# EAGLE board waveform (EAGLE 9.6.2), part 1 of 2
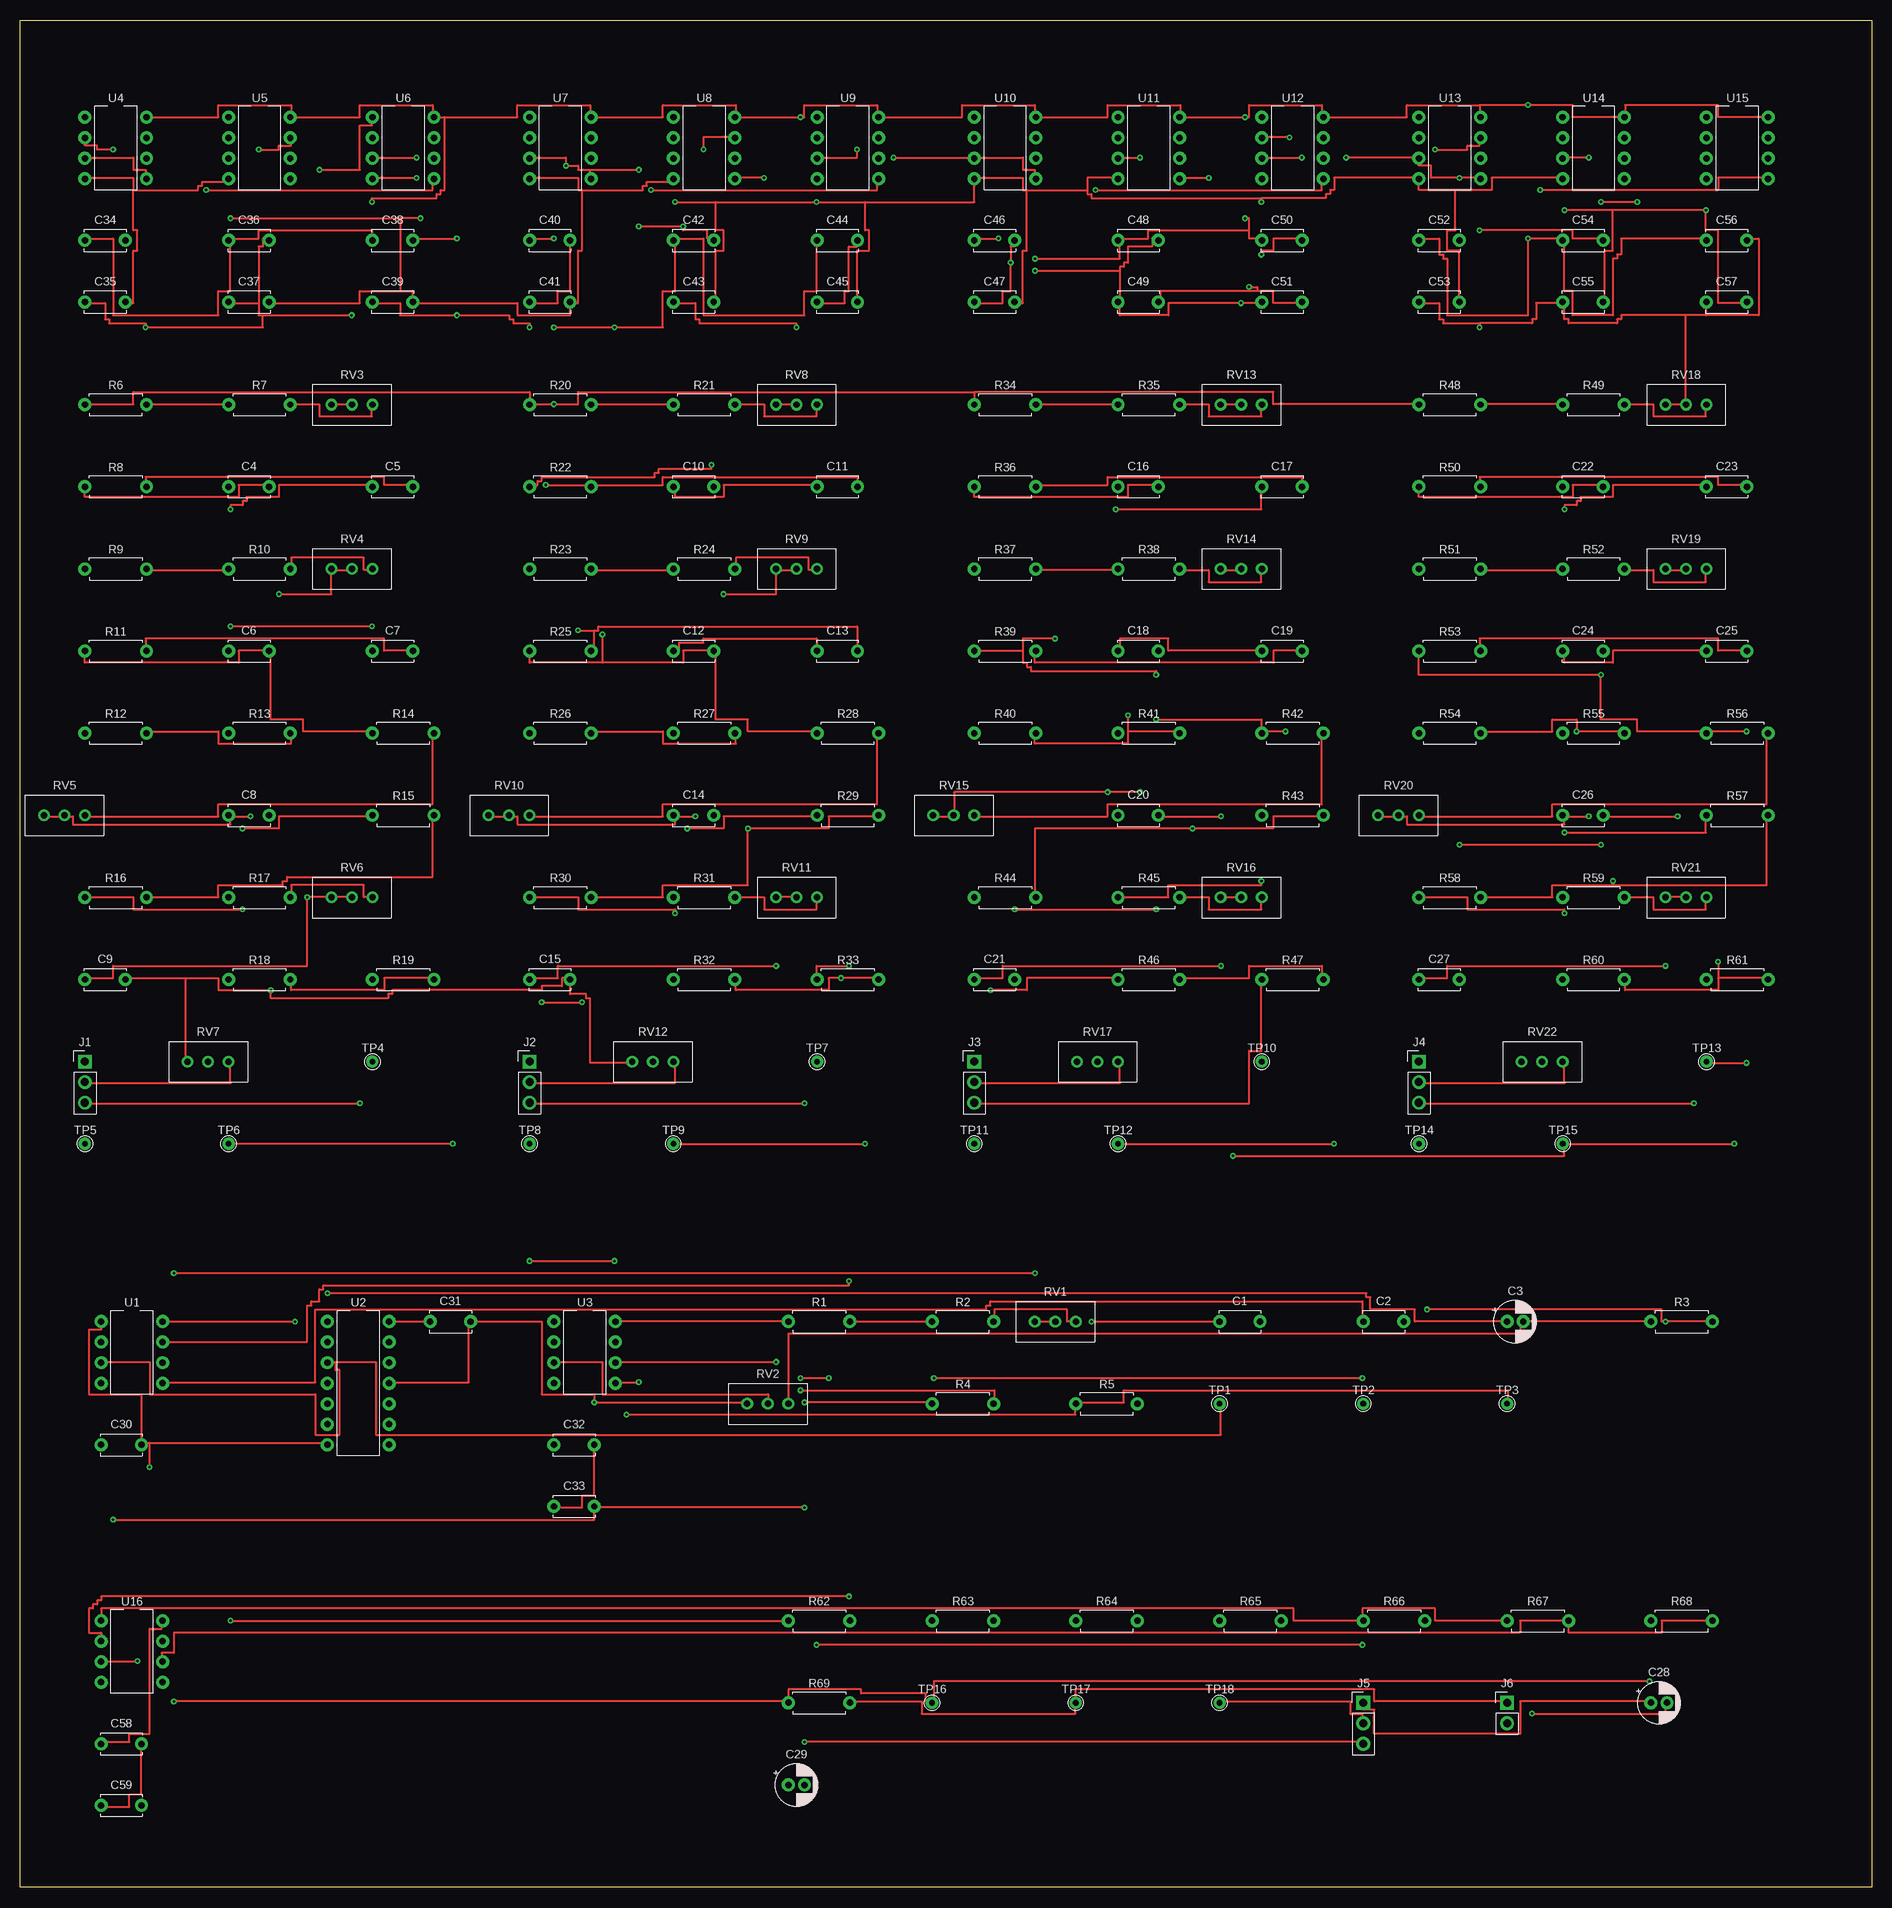
[diagram p9: board, top side]
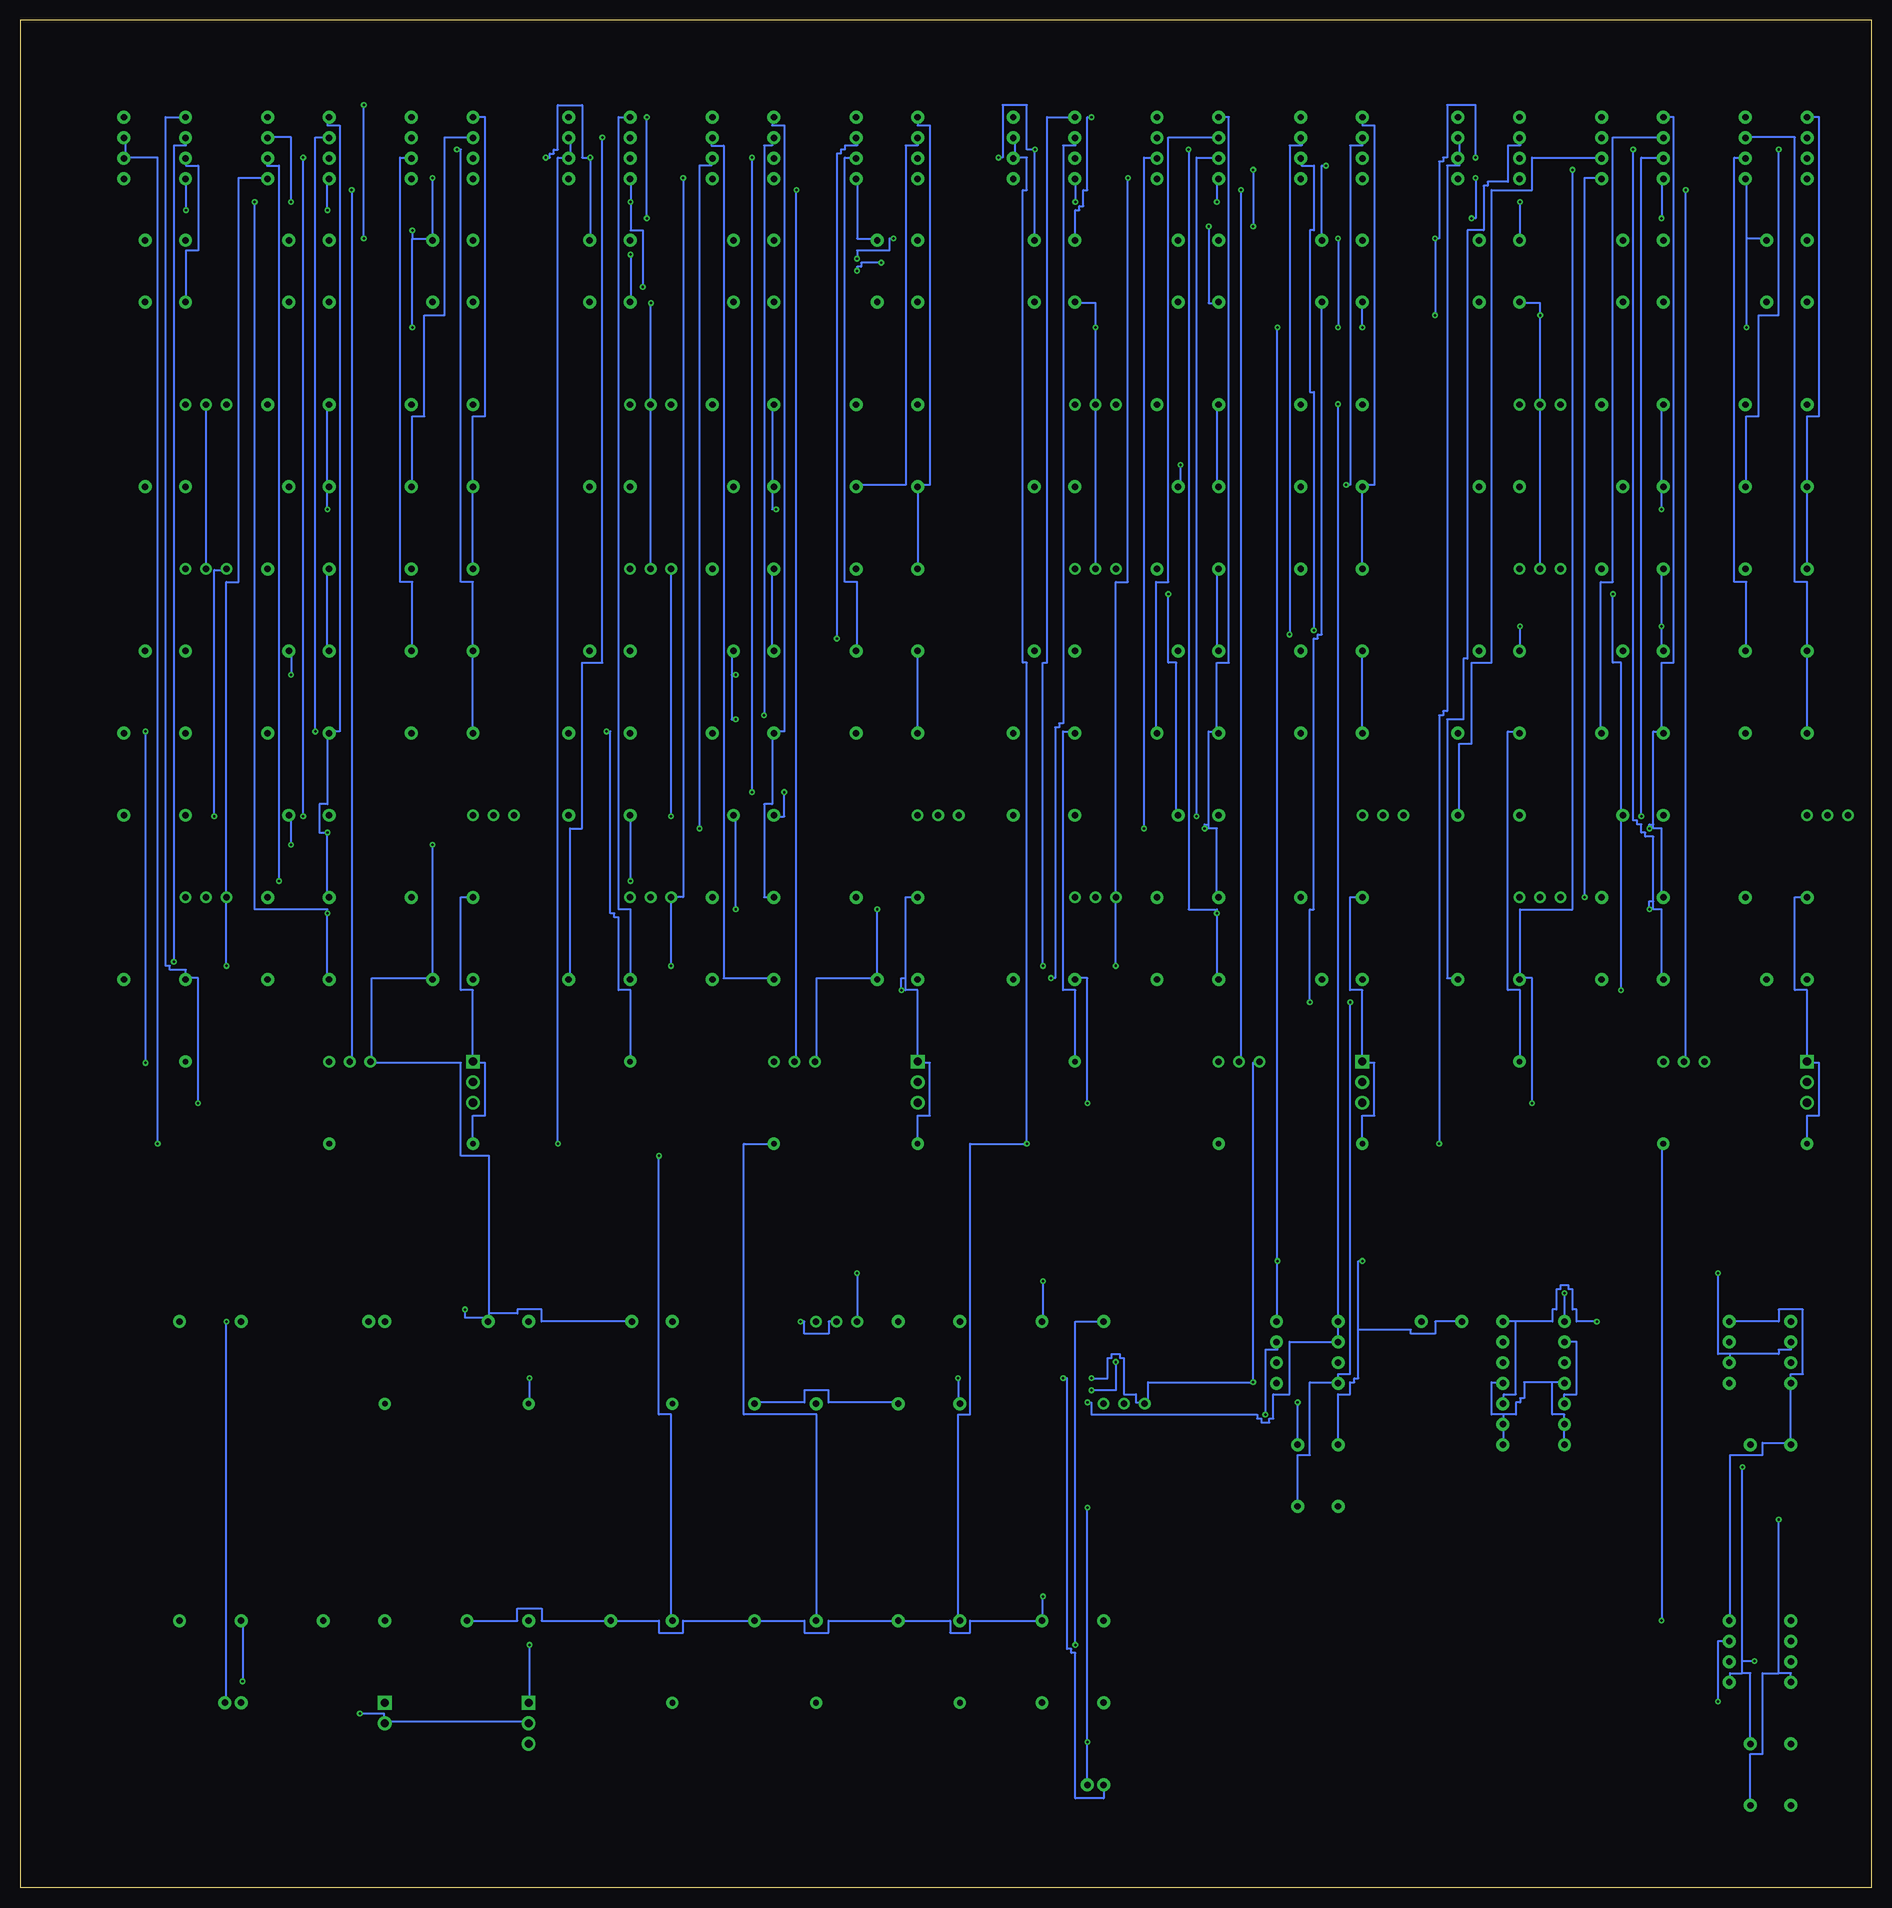
[diagram p10: board, bottom side, seen from below]

Size 229 x 231 mm. Coordinates in mm from the lower left corner, seen from the top.
Outline: 229,0 0,0 0,231 229,231 229,0
Copper layers (1*16): Top 0.035mm / Bottom 0.035mm
Design rules "Waveform_2layer_0.20mm": minimum track width 0.25mm, minimum drill 0.3mm, track to track 0.2mm, track to pad 0.2mm, pad to pad 0.2mm, via to via 0.2mm, copper to edge 0.5mm, stop-mask expansion 0.05mm
Net classes: 0 default: width 0.25 mm, drill 0.3 mm, clearance 0.2 mm

## Footprints (pad centres in the part's own frame; a part is rotated, then mirrored left to right if it is on the bottom)
C_Disc_D5.0mm_W2.5mm_P5.00mm = drill 0.8 pad 1.6 round: 1 0,0; 2 5,0
CP_Radial_D5.0mm_P2.00mm = drill 0.8 pad 1.6 round: 1 0,0; 2 2,0
PinHeader_1x03_P2.54mm_Vertical = drill 1 pad 1.7 square: 1 0,0 | drill 1 pad 1.7 round: 2 0,-2.54; 3 0,-5.08
PinHeader_1x02_P2.54mm_Vertical = drill 1 pad 1.7 square: 1 0,0 | drill 1 pad 1.7 round: 2 0,-2.54
R_Axial_DIN0207_L6.3mm_D2.5mm_P7.62mm_Horizontal = drill 0.8 pad 1.6 round: 1 0,0; 2 7.62,0
Potentiometer_Bourns_3296W_Vertical = drill 0.8 pad 1.44 round: 1 0,0; 2 -2.54,0; 3 -5.08,0
TestPoint_THTPad_D1.5mm_Drill0.7mm = drill 0.7 pad 1.5 round: 1 0,0
DIP-8_W7.62mm = drill 0.8 pad 1.6 round: 1 0,0; 2 0,-2.54; 3 0,-5.08; 4 0,-7.62; 5 7.62,-7.62; 6 7.62,-5.08; 7 7.62,-2.54; 8 7.62,0
DIP-14_W7.62mm = drill 0.8 pad 1.6 round: 1 0,0; 2 0,-2.54; 3 0,-5.08; 4 0,-7.62; 5 0,-10.16; 6 0,-12.7; 7 0,-15.24; 8 7.62,-15.24; 9 7.62,-12.7; 10 7.62,-10.16; 11 7.62,-7.62; 12 7.62,-5.08; 13 7.62,-2.54; 14 7.62,0

## Placement (x,y rotation side)
C1  10n  [C_Disc_D5.0mm_W2.5mm_P5.00mm]  148.34,70 0 top
C2  10n  [C_Disc_D5.0mm_W2.5mm_P5.00mm]  166.12,70 0 top
C3  10u/25V  [CP_Radial_D5.0mm_P2.00mm]  183.9,70 0 top
C4  10n  [C_Disc_D5.0mm_W2.5mm_P5.00mm]  25.78,173.28 0 top
C5  10n  [C_Disc_D5.0mm_W2.5mm_P5.00mm]  43.56,173.28 0 top
C6  10n  [C_Disc_D5.0mm_W2.5mm_P5.00mm]  25.78,152.96 0 top
C7  10n  [C_Disc_D5.0mm_W2.5mm_P5.00mm]  43.56,152.96 0 top
C8  10n  [C_Disc_D5.0mm_W2.5mm_P5.00mm]  25.78,132.64 0 top
C9  10n  [C_Disc_D5.0mm_W2.5mm_P5.00mm]  8,112.32 0 top
C10  3.3n  [C_Disc_D5.0mm_W2.5mm_P5.00mm]  80.78,173.28 0 top
C11  3.3n  [C_Disc_D5.0mm_W2.5mm_P5.00mm]  98.56,173.28 0 top
C12  3.3n  [C_Disc_D5.0mm_W2.5mm_P5.00mm]  80.78,152.96 0 top
C13  3.3n  [C_Disc_D5.0mm_W2.5mm_P5.00mm]  98.56,152.96 0 top
C14  3.3n  [C_Disc_D5.0mm_W2.5mm_P5.00mm]  80.78,132.64 0 top
C15  3.3n  [C_Disc_D5.0mm_W2.5mm_P5.00mm]  63,112.32 0 top
C16  2n  [C_Disc_D5.0mm_W2.5mm_P5.00mm]  135.78,173.28 0 top
C17  2n  [C_Disc_D5.0mm_W2.5mm_P5.00mm]  153.56,173.28 0 top
C18  2n  [C_Disc_D5.0mm_W2.5mm_P5.00mm]  135.78,152.96 0 top
C19  2n  [C_Disc_D5.0mm_W2.5mm_P5.00mm]  153.56,152.96 0 top
C20  2n  [C_Disc_D5.0mm_W2.5mm_P5.00mm]  135.78,132.64 0 top
C21  2n  [C_Disc_D5.0mm_W2.5mm_P5.00mm]  118,112.32 0 top
C22  1.5n  [C_Disc_D5.0mm_W2.5mm_P5.00mm]  190.78,173.28 0 top
C23  1.5n  [C_Disc_D5.0mm_W2.5mm_P5.00mm]  208.56,173.28 0 top
C24  1.5n  [C_Disc_D5.0mm_W2.5mm_P5.00mm]  190.78,152.96 0 top
C25  1.5n  [C_Disc_D5.0mm_W2.5mm_P5.00mm]  208.56,152.96 0 top
C26  1.5n  [C_Disc_D5.0mm_W2.5mm_P5.00mm]  190.78,132.64 0 top
C27  1.5n  [C_Disc_D5.0mm_W2.5mm_P5.00mm]  173,112.32 0 top
C28  47u/25V  [CP_Radial_D5.0mm_P2.00mm]  201.68,22.84 0 top
C29  47u/25V  [CP_Radial_D5.0mm_P2.00mm]  95,12.68 0 top
C30  100n  [C_Disc_D5.0mm_W2.5mm_P5.00mm]  10,54.76 0 top
C31  100n  [C_Disc_D5.0mm_W2.5mm_P5.00mm]  50.7,70 0 top
C32  100n  [C_Disc_D5.0mm_W2.5mm_P5.00mm]  66,54.76 0 top
C33  100n  [C_Disc_D5.0mm_W2.5mm_P5.00mm]  66,47.14 0 top
C34  100n  [C_Disc_D5.0mm_W2.5mm_P5.00mm]  8,203.76 0 top
C35  100n  [C_Disc_D5.0mm_W2.5mm_P5.00mm]  8,196.14 0 top
C36  100n  [C_Disc_D5.0mm_W2.5mm_P5.00mm]  25.78,203.76 0 top
C37  100n  [C_Disc_D5.0mm_W2.5mm_P5.00mm]  25.78,196.14 0 top
C38  100n  [C_Disc_D5.0mm_W2.5mm_P5.00mm]  43.56,203.76 0 top
C39  100n  [C_Disc_D5.0mm_W2.5mm_P5.00mm]  43.56,196.14 0 top
C40  100n  [C_Disc_D5.0mm_W2.5mm_P5.00mm]  63,203.76 0 top
C41  100n  [C_Disc_D5.0mm_W2.5mm_P5.00mm]  63,196.14 0 top
C42  100n  [C_Disc_D5.0mm_W2.5mm_P5.00mm]  80.78,203.76 0 top
C43  100n  [C_Disc_D5.0mm_W2.5mm_P5.00mm]  80.78,196.14 0 top
C44  100n  [C_Disc_D5.0mm_W2.5mm_P5.00mm]  98.56,203.76 0 top
C45  100n  [C_Disc_D5.0mm_W2.5mm_P5.00mm]  98.56,196.14 0 top
C46  100n  [C_Disc_D5.0mm_W2.5mm_P5.00mm]  118,203.76 0 top
C47  100n  [C_Disc_D5.0mm_W2.5mm_P5.00mm]  118,196.14 0 top
C48  100n  [C_Disc_D5.0mm_W2.5mm_P5.00mm]  135.78,203.76 0 top
C49  100n  [C_Disc_D5.0mm_W2.5mm_P5.00mm]  135.78,196.14 0 top
C50  100n  [C_Disc_D5.0mm_W2.5mm_P5.00mm]  153.56,203.76 0 top
C51  100n  [C_Disc_D5.0mm_W2.5mm_P5.00mm]  153.56,196.14 0 top
C52  100n  [C_Disc_D5.0mm_W2.5mm_P5.00mm]  173,203.76 0 top
C53  100n  [C_Disc_D5.0mm_W2.5mm_P5.00mm]  173,196.14 0 top
C54  100n  [C_Disc_D5.0mm_W2.5mm_P5.00mm]  190.78,203.76 0 top
C55  100n  [C_Disc_D5.0mm_W2.5mm_P5.00mm]  190.78,196.14 0 top
C56  100n  [C_Disc_D5.0mm_W2.5mm_P5.00mm]  208.56,203.76 0 top
C57  100n  [C_Disc_D5.0mm_W2.5mm_P5.00mm]  208.56,196.14 0 top
C58  100n  [C_Disc_D5.0mm_W2.5mm_P5.00mm]  10,17.76 0 top
C59  100n  [C_Disc_D5.0mm_W2.5mm_P5.00mm]  10,10.14 0 top
J1  PHASE_POLARITY  [PinHeader_1x03_P2.54mm_Vertical]  8,102.16 0 top
J2  PHASE_POLARITY  [PinHeader_1x03_P2.54mm_Vertical]  63,102.16 0 top
J3  PHASE_POLARITY  [PinHeader_1x03_P2.54mm_Vertical]  118,102.16 0 top
J4  PHASE_POLARITY  [PinHeader_1x03_P2.54mm_Vertical]  173,102.16 0 top
J5  POWER_12V  [PinHeader_1x03_P2.54mm_Vertical]  166.12,22.84 0 top
J6  WAVE_OUT  [PinHeader_1x02_P2.54mm_Vertical]  183.9,22.84 0 top
R1  10k  [R_Axial_DIN0207_L6.3mm_D2.5mm_P7.62mm_Horizontal]  95,70 0 top
R2  27k  [R_Axial_DIN0207_L6.3mm_D2.5mm_P7.62mm_Horizontal]  112.78,70 0 top
R3  1M  [R_Axial_DIN0207_L6.3mm_D2.5mm_P7.62mm_Horizontal]  201.68,70 0 top
R4  100k  [R_Axial_DIN0207_L6.3mm_D2.5mm_P7.62mm_Horizontal]  112.78,59.84 0 top
R5  100k  [R_Axial_DIN0207_L6.3mm_D2.5mm_P7.62mm_Horizontal]  130.56,59.84 0 top
R6  220k  [R_Axial_DIN0207_L6.3mm_D2.5mm_P7.62mm_Horizontal]  8,183.44 0 top
R7  430  [R_Axial_DIN0207_L6.3mm_D2.5mm_P7.62mm_Horizontal]  25.78,183.44 0 top
R8  470k  [R_Axial_DIN0207_L6.3mm_D2.5mm_P7.62mm_Horizontal]  8,173.28 0 top
R9  220k  [R_Axial_DIN0207_L6.3mm_D2.5mm_P7.62mm_Horizontal]  8,163.12 0 top
R10  430  [R_Axial_DIN0207_L6.3mm_D2.5mm_P7.62mm_Horizontal]  25.78,163.12 0 top
R11  470k  [R_Axial_DIN0207_L6.3mm_D2.5mm_P7.62mm_Horizontal]  8,152.96 0 top
R12  10k  [R_Axial_DIN0207_L6.3mm_D2.5mm_P7.62mm_Horizontal]  8,142.8 0 top
R13  10k  [R_Axial_DIN0207_L6.3mm_D2.5mm_P7.62mm_Horizontal]  25.78,142.8 0 top
R14  100  [R_Axial_DIN0207_L6.3mm_D2.5mm_P7.62mm_Horizontal]  43.56,142.8 0 top
R15  10k  [R_Axial_DIN0207_L6.3mm_D2.5mm_P7.62mm_Horizontal]  43.56,132.64 0 top
R16  10k  [R_Axial_DIN0207_L6.3mm_D2.5mm_P7.62mm_Horizontal]  8,122.48 0 top
R17  100  [R_Axial_DIN0207_L6.3mm_D2.5mm_P7.62mm_Horizontal]  25.78,122.48 0 top
R18  10k  [R_Axial_DIN0207_L6.3mm_D2.5mm_P7.62mm_Horizontal]  25.78,112.32 0 top
R19  10k  [R_Axial_DIN0207_L6.3mm_D2.5mm_P7.62mm_Horizontal]  43.56,112.32 0 top
R20  220k  [R_Axial_DIN0207_L6.3mm_D2.5mm_P7.62mm_Horizontal]  63,183.44 0 top
R21  430  [R_Axial_DIN0207_L6.3mm_D2.5mm_P7.62mm_Horizontal]  80.78,183.44 0 top
R22  470k  [R_Axial_DIN0207_L6.3mm_D2.5mm_P7.62mm_Horizontal]  63,173.28 0 top
R23  220k  [R_Axial_DIN0207_L6.3mm_D2.5mm_P7.62mm_Horizontal]  63,163.12 0 top
R24  430  [R_Axial_DIN0207_L6.3mm_D2.5mm_P7.62mm_Horizontal]  80.78,163.12 0 top
R25  470k  [R_Axial_DIN0207_L6.3mm_D2.5mm_P7.62mm_Horizontal]  63,152.96 0 top
R26  10k  [R_Axial_DIN0207_L6.3mm_D2.5mm_P7.62mm_Horizontal]  63,142.8 0 top
R27  10k  [R_Axial_DIN0207_L6.3mm_D2.5mm_P7.62mm_Horizontal]  80.78,142.8 0 top
R28  100  [R_Axial_DIN0207_L6.3mm_D2.5mm_P7.62mm_Horizontal]  98.56,142.8 0 top
R29  10k  [R_Axial_DIN0207_L6.3mm_D2.5mm_P7.62mm_Horizontal]  98.56,132.64 0 top
R30  10k  [R_Axial_DIN0207_L6.3mm_D2.5mm_P7.62mm_Horizontal]  63,122.48 0 top
R31  100  [R_Axial_DIN0207_L6.3mm_D2.5mm_P7.62mm_Horizontal]  80.78,122.48 0 top
R32  10k  [R_Axial_DIN0207_L6.3mm_D2.5mm_P7.62mm_Horizontal]  80.78,112.32 0 top
R33  10k  [R_Axial_DIN0207_L6.3mm_D2.5mm_P7.62mm_Horizontal]  98.56,112.32 0 top
R34  220k  [R_Axial_DIN0207_L6.3mm_D2.5mm_P7.62mm_Horizontal]  118,183.44 0 top
R35  430  [R_Axial_DIN0207_L6.3mm_D2.5mm_P7.62mm_Horizontal]  135.78,183.44 0 top
R36  470k  [R_Axial_DIN0207_L6.3mm_D2.5mm_P7.62mm_Horizontal]  118,173.28 0 top
R37  220k  [R_Axial_DIN0207_L6.3mm_D2.5mm_P7.62mm_Horizontal]  118,163.12 0 top
R38  430  [R_Axial_DIN0207_L6.3mm_D2.5mm_P7.62mm_Horizontal]  135.78,163.12 0 top
R39  470k  [R_Axial_DIN0207_L6.3mm_D2.5mm_P7.62mm_Horizontal]  118,152.96 0 top
R40  10k  [R_Axial_DIN0207_L6.3mm_D2.5mm_P7.62mm_Horizontal]  118,142.8 0 top
R41  10k  [R_Axial_DIN0207_L6.3mm_D2.5mm_P7.62mm_Horizontal]  135.78,142.8 0 top
R42  100  [R_Axial_DIN0207_L6.3mm_D2.5mm_P7.62mm_Horizontal]  153.56,142.8 0 top
R43  10k  [R_Axial_DIN0207_L6.3mm_D2.5mm_P7.62mm_Horizontal]  153.56,132.64 0 top
R44  10k  [R_Axial_DIN0207_L6.3mm_D2.5mm_P7.62mm_Horizontal]  118,122.48 0 top
R45  100  [R_Axial_DIN0207_L6.3mm_D2.5mm_P7.62mm_Horizontal]  135.78,122.48 0 top
R46  10k  [R_Axial_DIN0207_L6.3mm_D2.5mm_P7.62mm_Horizontal]  135.78,112.32 0 top
R47  10k  [R_Axial_DIN0207_L6.3mm_D2.5mm_P7.62mm_Horizontal]  153.56,112.32 0 top
R48  220k  [R_Axial_DIN0207_L6.3mm_D2.5mm_P7.62mm_Horizontal]  173,183.44 0 top
R49  430  [R_Axial_DIN0207_L6.3mm_D2.5mm_P7.62mm_Horizontal]  190.78,183.44 0 top
R50  470k  [R_Axial_DIN0207_L6.3mm_D2.5mm_P7.62mm_Horizontal]  173,173.28 0 top
R51  220k  [R_Axial_DIN0207_L6.3mm_D2.5mm_P7.62mm_Horizontal]  173,163.12 0 top
R52  430  [R_Axial_DIN0207_L6.3mm_D2.5mm_P7.62mm_Horizontal]  190.78,163.12 0 top
R53  470k  [R_Axial_DIN0207_L6.3mm_D2.5mm_P7.62mm_Horizontal]  173,152.96 0 top
R54  10k  [R_Axial_DIN0207_L6.3mm_D2.5mm_P7.62mm_Horizontal]  173,142.8 0 top
R55  10k  [R_Axial_DIN0207_L6.3mm_D2.5mm_P7.62mm_Horizontal]  190.78,142.8 0 top
R56  100  [R_Axial_DIN0207_L6.3mm_D2.5mm_P7.62mm_Horizontal]  208.56,142.8 0 top
R57  10k  [R_Axial_DIN0207_L6.3mm_D2.5mm_P7.62mm_Horizontal]  208.56,132.64 0 top
R58  10k  [R_Axial_DIN0207_L6.3mm_D2.5mm_P7.62mm_Horizontal]  173,122.48 0 top
R59  100  [R_Axial_DIN0207_L6.3mm_D2.5mm_P7.62mm_Horizontal]  190.78,122.48 0 top
R60  10k  [R_Axial_DIN0207_L6.3mm_D2.5mm_P7.62mm_Horizontal]  190.78,112.32 0 top
R61  10k  [R_Axial_DIN0207_L6.3mm_D2.5mm_P7.62mm_Horizontal]  208.56,112.32 0 top
R62  100k  [R_Axial_DIN0207_L6.3mm_D2.5mm_P7.62mm_Horizontal]  95,33 0 top
R63  100k  [R_Axial_DIN0207_L6.3mm_D2.5mm_P7.62mm_Horizontal]  112.78,33 0 top
R64  100k  [R_Axial_DIN0207_L6.3mm_D2.5mm_P7.62mm_Horizontal]  130.56,33 0 top
R65  100k  [R_Axial_DIN0207_L6.3mm_D2.5mm_P7.62mm_Horizontal]  148.34,33 0 top
R66  100k  [R_Axial_DIN0207_L6.3mm_D2.5mm_P7.62mm_Horizontal]  166.12,33 0 top
R67  100k  [R_Axial_DIN0207_L6.3mm_D2.5mm_P7.62mm_Horizontal]  183.9,33 0 top
R68  100k  [R_Axial_DIN0207_L6.3mm_D2.5mm_P7.62mm_Horizontal]  201.68,33 0 top
R69  100  [R_Axial_DIN0207_L6.3mm_D2.5mm_P7.62mm_Horizontal]  95,22.84 0 top
RV1  20k  [Potentiometer_Bourns_3296W_Vertical]  130.56,70 0 top
RV2  100k  [Potentiometer_Bourns_3296W_Vertical]  95,59.84 0 top
RV3  200  [Potentiometer_Bourns_3296W_Vertical]  43.56,183.44 0 top
RV4  200  [Potentiometer_Bourns_3296W_Vertical]  43.56,163.12 0 top
RV5  200k  [Potentiometer_Bourns_3296W_Vertical]  8,132.64 0 top
RV6  200k  [Potentiometer_Bourns_3296W_Vertical]  43.56,122.48 0 top
RV7  10k  [Potentiometer_Bourns_3296W_Vertical]  25.78,102.16 0 top
RV8  200  [Potentiometer_Bourns_3296W_Vertical]  98.56,183.44 0 top
RV9  200  [Potentiometer_Bourns_3296W_Vertical]  98.56,163.12 0 top
RV10  200k  [Potentiometer_Bourns_3296W_Vertical]  63,132.64 0 top
RV11  200k  [Potentiometer_Bourns_3296W_Vertical]  98.56,122.48 0 top
RV12  10k  [Potentiometer_Bourns_3296W_Vertical]  80.78,102.16 0 top
RV13  200  [Potentiometer_Bourns_3296W_Vertical]  153.56,183.44 0 top
RV14  200  [Potentiometer_Bourns_3296W_Vertical]  153.56,163.12 0 top
RV15  200k  [Potentiometer_Bourns_3296W_Vertical]  118,132.64 0 top
RV16  200k  [Potentiometer_Bourns_3296W_Vertical]  153.56,122.48 0 top
RV17  10k  [Potentiometer_Bourns_3296W_Vertical]  135.78,102.16 0 top
RV18  200  [Potentiometer_Bourns_3296W_Vertical]  208.56,183.44 0 top
RV19  200  [Potentiometer_Bourns_3296W_Vertical]  208.56,163.12 0 top
RV20  200k  [Potentiometer_Bourns_3296W_Vertical]  173,132.64 0 top
RV21  200k  [Potentiometer_Bourns_3296W_Vertical]  208.56,122.48 0 top
RV22  10k  [Potentiometer_Bourns_3296W_Vertical]  190.78,102.16 0 top
TP1  CLOCK_2K  [TestPoint_THTPad_D1.5mm_Drill0.7mm]  148.34,59.84 0 top
TP2  SQ  [TestPoint_THTPad_D1.5mm_Drill0.7mm]  166.12,59.84 0 top
TP3  SQ_INV  [TestPoint_THTPad_D1.5mm_Drill0.7mm]  183.9,59.84 0 top
TP4  H1_BPF2  [TestPoint_THTPad_D1.5mm_Drill0.7mm]  43.56,102.16 0 top
TP5  H1_AP2  [TestPoint_THTPad_D1.5mm_Drill0.7mm]  8,92 0 top
TP6  H1_OUT  [TestPoint_THTPad_D1.5mm_Drill0.7mm]  25.78,92 0 top
TP7  H3_BPF2  [TestPoint_THTPad_D1.5mm_Drill0.7mm]  98.56,102.16 0 top
TP8  H3_AP2  [TestPoint_THTPad_D1.5mm_Drill0.7mm]  63,92 0 top
TP9  H3_OUT  [TestPoint_THTPad_D1.5mm_Drill0.7mm]  80.78,92 0 top
TP10  H5_BPF2  [TestPoint_THTPad_D1.5mm_Drill0.7mm]  153.56,102.16 0 top
TP11  H5_AP2  [TestPoint_THTPad_D1.5mm_Drill0.7mm]  118,92 0 top
TP12  H5_OUT  [TestPoint_THTPad_D1.5mm_Drill0.7mm]  135.78,92 0 top
TP13  H7_BPF2  [TestPoint_THTPad_D1.5mm_Drill0.7mm]  208.56,102.16 0 top
TP14  H7_AP2  [TestPoint_THTPad_D1.5mm_Drill0.7mm]  173,92 0 top
TP15  H7_OUT  [TestPoint_THTPad_D1.5mm_Drill0.7mm]  190.78,92 0 top
TP16  SUM_RAW  [TestPoint_THTPad_D1.5mm_Drill0.7mm]  112.78,22.84 0 top
TP17  OUT  [TestPoint_THTPad_D1.5mm_Drill0.7mm]  130.56,22.84 0 top
TP18  GND  [TestPoint_THTPad_D1.5mm_Drill0.7mm]  148.34,22.84 0 top
U1  NE555P  [DIP-8_W7.62mm]  10,70 0 top
U2  CD4013BE  [DIP-14_W7.62mm]  38,70 0 top
U3  TL082CP  [DIP-8_W7.62mm]  66,70 0 top
U4  TL082CP  [DIP-8_W7.62mm]  8,219 0 top
U5  TL082CP  [DIP-8_W7.62mm]  25.78,219 0 top
U6  TL082CP  [DIP-8_W7.62mm]  43.56,219 0 top
U7  TL082CP  [DIP-8_W7.62mm]  63,219 0 top
U8  TL082CP  [DIP-8_W7.62mm]  80.78,219 0 top
U9  TL082CP  [DIP-8_W7.62mm]  98.56,219 0 top
U10  TL082CP  [DIP-8_W7.62mm]  118,219 0 top
U11  TL082CP  [DIP-8_W7.62mm]  135.78,219 0 top
U12  TL082CP  [DIP-8_W7.62mm]  153.56,219 0 top
U13  TL082CP  [DIP-8_W7.62mm]  173,219 0 top
U14  TL082CP  [DIP-8_W7.62mm]  190.78,219 0 top
U15  TL082CP  [DIP-8_W7.62mm]  208.56,219 0 top
U16  TL082CP  [DIP-8_W7.62mm]  10,33 0 top